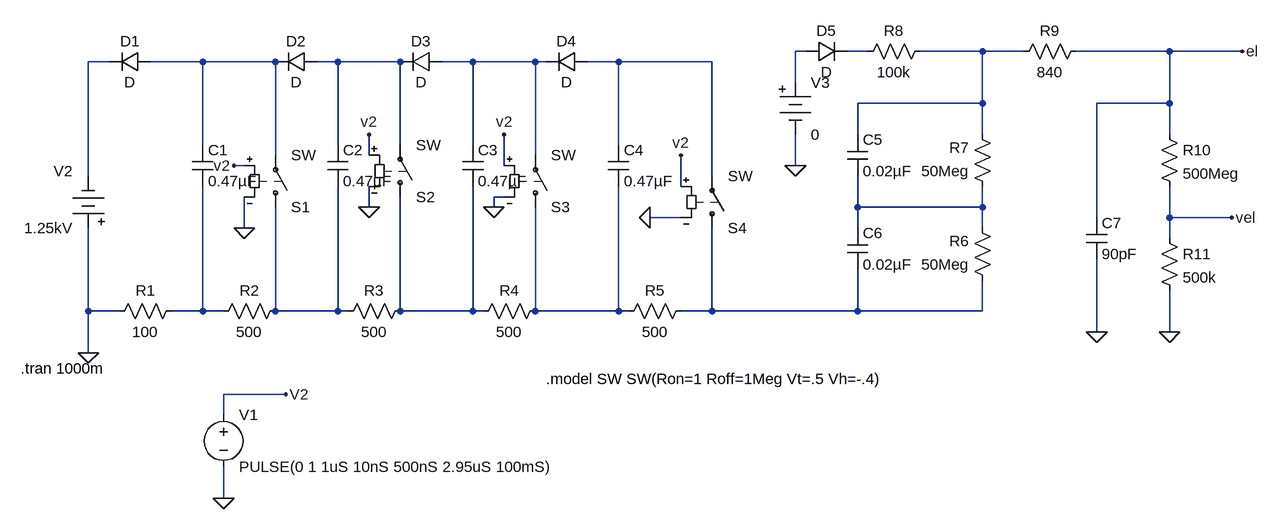
[diagram p0: schematic marxgeneratpr.asc]
marxgeneratpr.asc, the LTspice schematic file:
Version 4.1
SHEET 1 1320 884
WIRE 608 176 592 176
WIRE 704 176 672 176
WIRE 880 176 784 176
WIRE 944 176 880 176
WIRE 1168 176 1024 176
WIRE 1280 176 1168 176
WIRE -464 192 -496 192
WIRE -320 192 -400 192
WIRE -208 192 -320 192
WIRE -112 192 -144 192
WIRE -16 192 -112 192
WIRE 96 192 48 192
WIRE 192 192 96 192
WIRE 208 192 192 192
WIRE 320 192 272 192
WIRE 464 192 320 192
WIRE 592 224 592 176
WIRE 880 256 880 176
WIRE 880 256 688 256
WIRE 1168 256 1168 176
WIRE 1168 256 1056 256
WIRE 688 304 688 256
WIRE 880 304 880 256
WIRE 1168 304 1168 256
WIRE -320 320 -320 192
WIRE -112 320 -112 192
WIRE -16 320 -16 192
WIRE 96 320 96 192
WIRE 320 320 320 192
WIRE -208 336 -208 192
WIRE -64 336 -64 304
WIRE 192 336 192 192
WIRE -256 352 -272 352
WIRE 144 352 144 304
WIRE 592 352 592 304
WIRE -496 368 -496 192
WIRE 464 368 464 192
WIRE 416 384 416 336
WIRE 144 400 128 400
WIRE -64 416 -64 384
WIRE 128 416 128 400
WIRE 688 416 688 368
WIRE 880 416 880 384
WIRE 880 416 688 416
WIRE 416 432 368 432
WIRE 1056 432 1056 256
WIRE 1168 432 1168 384
WIRE 1264 432 1168 432
WIRE -256 448 -256 400
WIRE 688 448 688 416
WIRE 880 448 880 416
WIRE 1168 464 1168 432
WIRE -496 576 -496 448
WIRE -448 576 -496 576
WIRE -320 576 -320 384
WIRE -320 576 -368 576
WIRE -288 576 -320 576
WIRE -208 576 -208 416
WIRE -112 576 -112 384
WIRE -112 576 -208 576
WIRE -96 576 -112 576
WIRE -16 576 -16 400
WIRE 96 576 96 384
WIRE 96 576 -16 576
WIRE 112 576 96 576
WIRE 192 576 192 416
WIRE 320 576 320 384
WIRE 320 576 192 576
WIRE 336 576 320 576
WIRE 464 576 464 448
WIRE 464 576 416 576
WIRE 688 576 688 512
WIRE 688 576 464 576
WIRE 880 576 880 528
WIRE 880 576 688 576
WIRE 1056 608 1056 496
WIRE 1168 608 1168 544
WIRE -496 640 -496 576
WIRE -192 704 -288 704
WIRE -288 736 -288 704
WIRE -288 864 -288 816
FLAG -288 864 0
FLAG -192 704 V2
FLAG -496 640 0
FLAG 128 416 0
FLAG 592 352 0
FLAG 1168 608 0
FLAG 1056 608 0
FLAG 1280 176 el
FLAG 1264 432 vel
FLAG 368 432 0
FLAG -64 416 0
FLAG -256 448 0
FLAG -272 352 v2
FLAG -64 304 v2
FLAG 416 336 v2
FLAG 144 304 v2
SYMBOL voltage -288 720 R0
SYMATTR InstName V1
SYMATTR Value PULSE(0 1 1uS 10nS 500nS 2.95uS 100mS)
SYMBOL Misc\\battery -496 464 R180
WINDOW 0 24 104 Left 2
WINDOW 3 24 16 Left 2
SYMATTR InstName V2
SYMATTR Value 1.25kV
SYMBOL diode -400 176 R90
WINDOW 0 0 32 VBottom 2
WINDOW 3 32 32 VTop 2
SYMATTR InstName D1
SYMBOL res -352 560 R90
WINDOW 0 0 56 VBottom 2
WINDOW 3 32 56 VTop 2
SYMATTR InstName R1
SYMATTR Value 100
SYMBOL res -192 560 R90
WINDOW 0 0 56 VBottom 2
WINDOW 3 32 56 VTop 2
SYMATTR InstName R2
SYMATTR Value 500
SYMBOL res 0 560 R90
WINDOW 0 0 56 VBottom 2
WINDOW 3 32 56 VTop 2
SYMATTR InstName R3
SYMATTR Value 500
SYMBOL res 208 560 R90
WINDOW 0 0 56 VBottom 2
WINDOW 3 32 56 VTop 2
SYMATTR InstName R4
SYMATTR Value 500
SYMBOL res 432 560 R90
WINDOW 0 0 56 VBottom 2
WINDOW 3 32 56 VTop 2
SYMATTR InstName R5
SYMATTR Value 500
SYMBOL res 896 544 R180
WINDOW 0 36 76 Left 2
WINDOW 3 36 40 Left 2
SYMATTR InstName R6
SYMATTR Value 50Meg
SYMBOL res 896 400 R180
WINDOW 0 36 76 Left 2
WINDOW 3 36 40 Left 2
SYMATTR InstName R7
SYMATTR Value 50Meg
SYMBOL res 688 192 R270
WINDOW 0 32 56 VTop 2
WINDOW 3 0 56 VBottom 2
SYMATTR InstName R8
SYMATTR Value 100k
SYMBOL diode -144 176 R90
WINDOW 0 0 32 VBottom 2
WINDOW 3 32 32 VTop 2
SYMATTR InstName D2
SYMBOL diode 48 176 R90
WINDOW 0 0 32 VBottom 2
WINDOW 3 32 32 VTop 2
SYMATTR InstName D3
SYMBOL diode 272 176 R90
WINDOW 0 0 32 VBottom 2
WINDOW 3 32 32 VTop 2
SYMATTR InstName D4
SYMBOL sw -208 432 M180
SYMATTR InstName S1
SYMBOL sw -16 416 M180
SYMATTR InstName S2
SYMBOL sw 192 432 M180
SYMATTR InstName S3
SYMBOL sw 464 464 M180
SYMATTR InstName S4
SYMBOL cap -336 320 R0
SYMATTR InstName C1
SYMATTR Value 0.47µF
SYMBOL cap -128 320 R0
SYMATTR InstName C2
SYMATTR Value 0.47µF
SYMBOL cap 80 320 R0
SYMATTR InstName C3
SYMATTR Value 0.47µF
SYMBOL cap 304 320 R0
SYMATTR InstName C4
SYMATTR Value 0.47µF
SYMBOL Misc\\battery 592 208 R0
WINDOW 123 0 0 Left 0
WINDOW 39 0 0 Left 0
SYMATTR InstName V3
SYMATTR Value 0
SYMBOL diode 608 192 R270
WINDOW 0 32 32 VTop 2
WINDOW 3 0 32 VBottom 2
SYMATTR InstName D5
SYMBOL cap 672 304 R0
SYMATTR InstName C5
SYMATTR Value 0.02µF
SYMBOL cap 672 448 R0
SYMATTR InstName C6
SYMATTR Value 0.02µF
SYMBOL res 1040 160 R90
WINDOW 0 0 56 VBottom 2
WINDOW 3 32 56 VTop 2
SYMATTR InstName R9
SYMATTR Value 840
SYMBOL res 1152 288 R0
SYMATTR InstName R10
SYMATTR Value 500Meg
SYMBOL res 1152 448 R0
SYMATTR InstName R11
SYMATTR Value 500k
SYMBOL cap 1040 432 R0
SYMATTR InstName C7
SYMATTR Value 90pF
TEXT -600 664 Left 2 !.tran 1000m
TEXT 208 680 Left 2 !.model SW SW(Ron=1 Roff=1Meg Vt=.5 Vh=-.4)

The netlist it stands for:
* marxgeneratpr.asc
V1 V2 0 PULSE(0 1 1uS 10nS 500nS 2.95uS 100mS)
V2 0 N004 1.25kV
D1 N005 N004 D
R1 N010 0 100
R2 N011 N010 500
R3 N012 N011 500
R4 N013 N012 500
R5 N014 N013 500
R6 N014 N009 50Meg
R7 N009 N003 50Meg
R8 N002 N003 100k
D2 N006 N005 D
D3 N007 N006 D
D4 N008 N007 D
S1 N011 N005 V2 0 SW
S2 N012 N006 V2 0 SW
S3 N013 N007 V2 0 SW
S4 N014 N008 V2 0 SW
C1 N005 N010 0.47µF
C2 N006 N011 0.47µF
C3 N007 N012 0.47µF
C4 N008 N013 0.47µF
V3 N001 0 0
D5 N001 N002 D
C5 N003 N009 0.02µF
C6 N009 N014 0.02µF
R9 el N003 840
R10 el vel 500Meg
R11 vel 0 500k
C7 el 0 90pF
.model D D
.lib standard.dio
.tran 1000m
.model SW SW(Ron=1 Roff=1Meg Vt=.5 Vh=-.4)
.backanno
.end